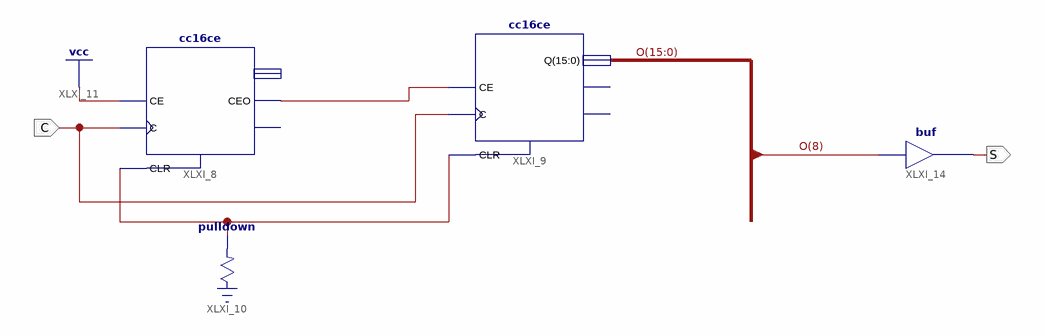
[diagram p0: schematic sheet 1]
// Xilinx ISE schematic DIV.sch (spartan3e) as structural Verilog: 4 symbols, 2 ports
module DIV (
  input  C,
  output S
);

  wire XLXN_15, XLXN_18;
  wire [15:0] O;

  cc16ce XLXI_8 (.C(C), .CE(1'b1), .CLR(XLXN_18), .CEO(XLXN_15));  // open: Q, TC
  cc16ce XLXI_9 (.C(C), .CE(XLXN_15), .CLR(XLXN_18), .Q(O));  // open: CEO, TC
  \pulldown  XLXI_10 (.O(XLXN_18));
  buf XLXI_14 (S, O[8]);
endmodule
